# Altium project EVLSERVO1_control_v2.PrjPcb (part 5 of 9)
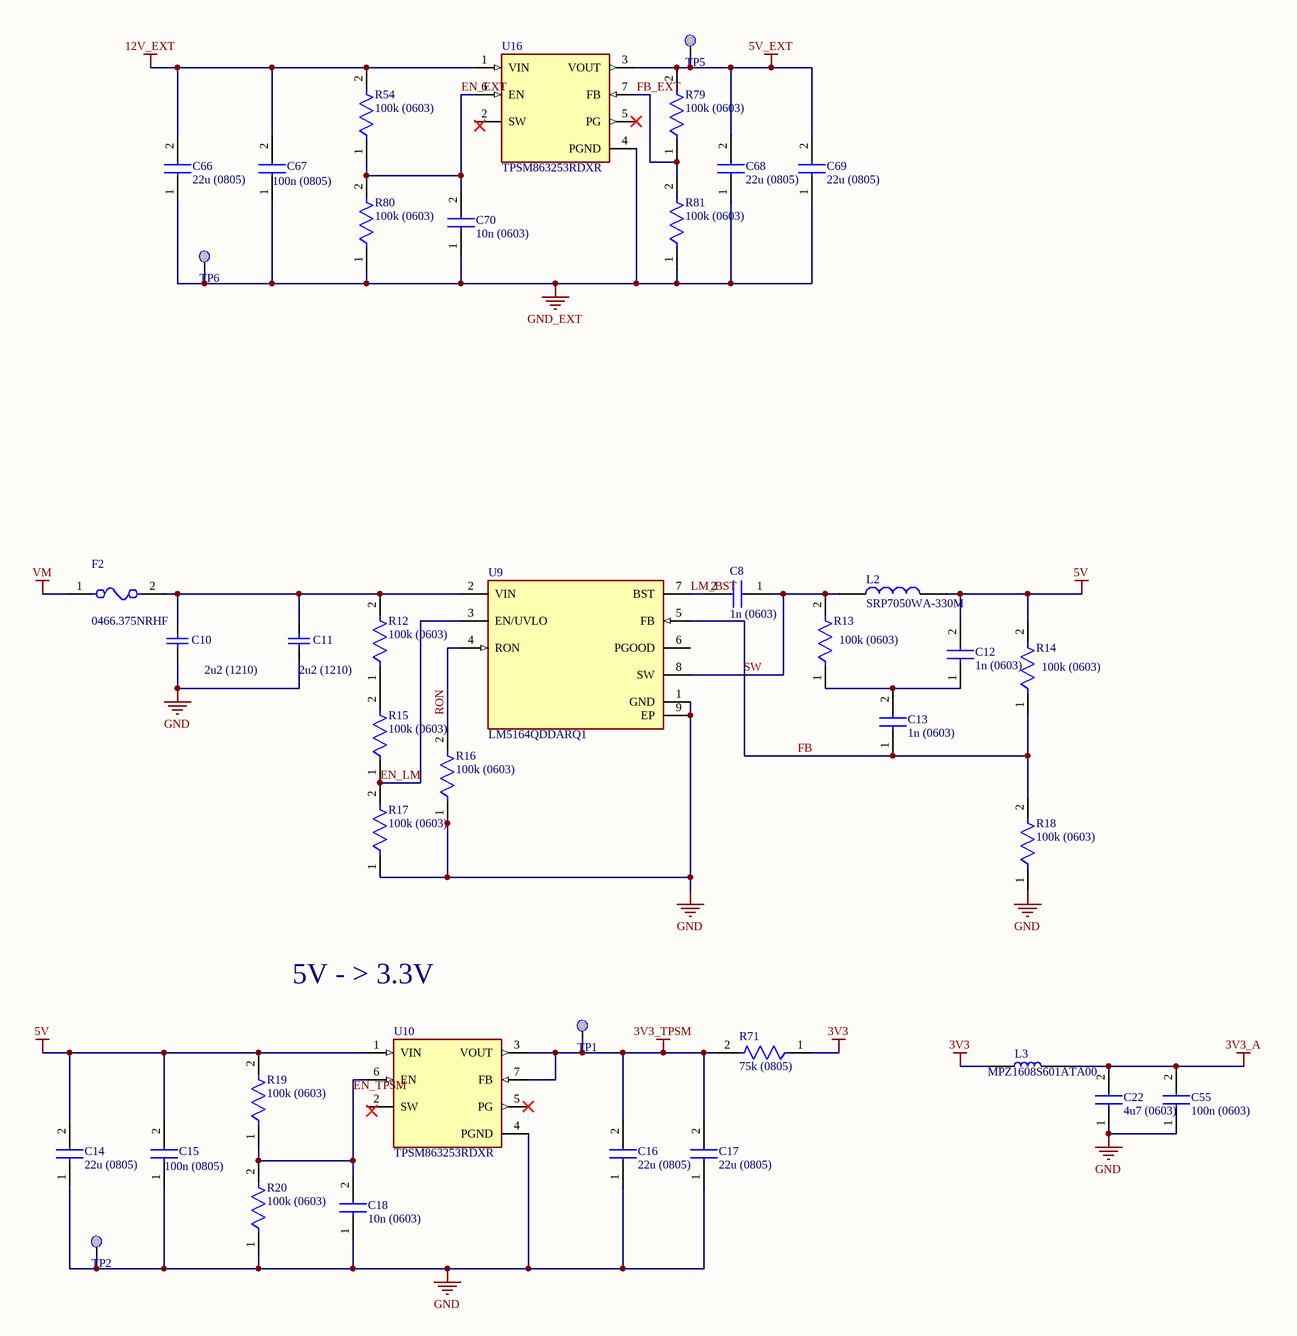
[diagram p8: power.SchDoc]

## Sheet power.SchDoc (continued)
### Library data of the parts
C8 C12 C13 = GCM188R71E102KA37D: Cap Ceramic 0.001uF 25V X7R 10% Pad SMD 0603 125C Automotive T/R; Manufacturer_Name: Murata Electronics; Manufacturer_Part_Number: GCM188R71E104JA57D; Manufacturer: Murata; Manufacturer Lifecycle Status: NRND; Value: 100nF; Datasheet Link: https://search.murata.co.jp/Ceramy/image/img/A01X/G101/ENG/GCM188R71E104JA57-01A.pdf; Height: 0.9mm; Mouser Part Number: 81-GCM188R71E104JAD; Mouser Price/Stock: https://www.mouser.co.uk/ProductDetail/Murata-Electronics/GCM188R71E104JA57D?qs=ui%252B2d9lVEI5lLkZDVYlCng%3D%3D; Arrow Part Number: GCM188R71E104JA57D; Arrow Price/Stock: https://www.arrow.com/en/products/gcm188r71e104ja57d/murata-manufacturing; Supplier: DigiKey; Supplier Part Number: 490-GCM188R71E104JA57DCT-ND; Manufacturer Part Number: GCM188R71E104JA57D; RoHS: Compliant; Category: Ceramic Capacitors; Stock: 2875; Pricing: 1=0,33, 10=0,196, 50=0,1434, 100=0,1272, 500=0,09986, 1000=0,09143 (USD); Case/Package: 0603; Country of Origin: Philippines; Dielectric Material: Ceramic; Export Control Classification Number (ECCN) Code: EAR99; Harmonized Tariff Schedule (HTS) Code: 8532.24.00.20; Introduction Date: 2013-11-20; Length: 1.6mm; Lifecycle Status: NRND; Max Operating Temperature: 125°C; Min Operating Temperature: -55°C; Mounting Technology: Surface Mount; Number of Terminals: 2; Ratings: AEC-Q200; REACH SVHC: Yes; Schedule B: 8532240020, 8532240020|8532240020|8532240020|8532240020|8532240020; Thickness: 800µm; Voltage Rating (DC): 25V; Width: 800µm; ComponentLink1URL: https://datasheet.octopart.com:443/GCM188R71E104JA57D-Murata-datasheet-141267551.pdf?src-supplier=Geoflip; ComponentLink1Description: https://datasheet.octopart.com:443/GCM188R71E104JA57D-Murata-datasheet-141267551.pdf?src-supplier=Geoflip; ComponentLink2URL: https://datasheet.octopart.com:443/GCM188R71E104JA57D-Murata-datasheet-140658663.pdf?src-supplier=Ciiva; ComponentLink2Description: https://datasheet.octopart.com:443/GCM188R71E104JA57D-Murata-datasheet-140658663.pdf?src-supplier=Ciiva; ComponentLink3URL: https://datasheet.octopart.com:443/GCM188R71E104JA57D-Murata-datasheet-138718229.pdf?src-supplier=Ciiva; ComponentLink3Description: https://datasheet.octopart.com:443/GCM188R71E104JA57D-Murata-datasheet-138718229.pdf?src-supplier=Ciiva; ComponentLink4URL: http://sigma.octopart.com:80/reach_statement/Murata-company-16.pdf?src-supplier=Compliance+Statements; ComponentLink4Description: http://sigma.octopart.com:80/reach_statement/Murata-company-16.pdf?src-supplier=Compliance+Statements; Case Code (Imperial): 0603; Case Code (Metric): 1608; Depth: 800µm; Dielectric: X7R; Packaging: Tape & Reel; Radiation Hardening: No; Termination: SMD/SMT; Tolerance: 10%; Voltage Rating: 25V; ComponentLink5URL: https://datasheet.octopart.com:443/GCM188R71E102KA37D-Murata-datasheet-141267546.pdf?src-supplier=Geoflip; ComponentLink5Description: https://datasheet.octopart.com:443/GCM188R71E102KA37D-Murata-datasheet-141267546.pdf?src-supplier=Geoflip; ComponentLink6URL: https://datasheet.octopart.com:443/GCM188R71E102KA37D-Murata-datasheet-140658658.pdf?src-supplier=Ciiva; ComponentLink6Description: https://datasheet.octopart.com:443/GCM188R71E102KA37D-Murata-datasheet-140658658.pdf?src-supplier=Ciiva; ComponentLink7URL: https://datasheet.octopart.com:443/GCM188R71E102KA37D-Murata-datasheet-138718224.pdf?src-supplier=Ciiva; ComponentLink7Description: https://datasheet.octopart.com:443/GCM188R71E102KA37D-Murata-datasheet-138718224.pdf?src-supplier=Ciiva; ComponentLink8URL: https://datasheet.octopart.com/GCM188R71E102KA37D-Murata-datasheet-14404865.pdf; ComponentLink8Description: https://datasheet.octopart.com/GCM188R71E102KA37D-Murata-datasheet-14404865.pdf
C10 C11 = CMP-03913-104794504-2: Cap, 2.2Uf, 100V, Mlcc, 1210 Rohs Compliant: Yes 885012209071; Insulation Resistance: 50MΩ; Length: 3.2mm; Min Operating Temperature: -55°C; Voltage Rating: 100V; Width: 2.5mm; Max Operating Temperature: 125°C; Height: 2.5mm; RoHS: Compliant; Parameter 1: *
C14 C16 C17 C66 C68 C69 = GMC21X5R226K16NT: Ceramic Capacitor, Multilayer, Ceramic, 16V, 10% +Tol, 10% -Tol, X5R, 15% TC, 22uF, Surface Mount, 0805; Manufacturer_Name: Murata Electronics; Manufacturer_Part_Number: GRM21BZ71E475KE15L; Manufacturer: Murata; Manufacturer Lifecycle Status: IN PRODUCTION; Value: 4.7µF; Voltage Rating: 25V; Dielectric: X7R; Voltage: 100V; Datasheet Link: https://search.murata.co.jp/Ceramy/image/img/A01X/G101/ENG/GRM21BZ71E475KE15-01A.pdf; Height: 1.45mm; Mouser Part Number: 81-GRM21BZ71E475KE5L; Mouser Price/Stock: https://www.mouser.co.uk/ProductDetail/Murata-Electronics/GRM21BZ71E475KE15L?qs=Ey7%2FXF42M3feXnDNgc%252BFlQ%3D%3D; Arrow Part Number: GRM21BZ71E475KE15L; Arrow Price/Stock: https://www.arrow.com/en/products/grm21bz71e475ke15l/murata-manufacturing?utm_currency=USD&region=nac; Supplier: RS; Supplier Part Number: 2478136; Manufacturer Part Number: GRM21BZ71E475KE15L; RoHS: Compliant; Category: Ceramic Capacitors; Stock: 4700; Case/Package: 0805; Dielectric Material: Ceramic; Export Control Classification Number (ECCN) Code: EAR99; Harmonized Tariff Schedule (HTS) Code: 8532.24.00.20; Introduction Date: 2017-02-22; Length: 2mm; Lifecycle Status: Production; Material: Ceramic; Max Operating Temperature: 125°C; Min Operating Temperature: -55°C; Mounting Technology: Surface Mount; Number of Terminals: 2; REACH SVHC: Yes; Thickness: 1.25mm; Tolerance: 10%; Voltage Rating (DC): 25V; Width: 1.25mm; ComponentLink1URL: https://datasheet.octopart.com:443/GRM21BZ71E475KE15L-Murata-datasheet-155345087.pdf?src-supplier=Newark; ComponentLink1Description: https://datasheet.octopart.com:443/GRM21BZ71E475KE15L-Murata-datasheet-155345087.pdf?src-supplier=Newark; ComponentLink2URL: https://datasheet.octopart.com:443/GRM21BZ71E475KE15L-Murata-datasheet-141278877.pdf?src-supplier=Geoflip; ComponentLink2Description: https://datasheet.octopart.com:443/GRM21BZ71E475KE15L-Murata-datasheet-141278877.pdf?src-supplier=Geoflip; ComponentLink3URL: https://datasheet.octopart.com:443/GRM21BZ71E475KE15L-Murata-datasheet-165579666.pdf?src-supplier=TME; ComponentLink3Description: https://datasheet.octopart.com:443/GRM21BZ71E475KE15L-Murata-datasheet-165579666.pdf?src-supplier=TME; ComponentLink4URL: https://datasheet.octopart.com:443/GRM21BZ71E475KE15L-Murata-datasheet-140707839.pdf?src-supplier=Ciiva; ComponentLink4Description: https://datasheet.octopart.com:443/GRM21BZ71E475KE15L-Murata-datasheet-140707839.pdf?src-supplier=Ciiva; ComponentLink5URL: https://datasheet.octopart.com:443/GRM21BZ71E475KE15L-Murata-datasheet-138745135.pdf?src-supplier=Ciiva; ComponentLink5Description: https://datasheet.octopart.com:443/GRM21BZ71E475KE15L-Murata-datasheet-138745135.pdf?src-supplier=Ciiva; ComponentLink6URL: http://sigma.octopart.com:80/reach_statement/Murata-company-16.pdf?src-supplier=Compliance+Statements; ComponentLink6Description: http://sigma.octopart.com:80/reach_statement/Murata-company-16.pdf?src-supplier=Compliance+Statements; Case Code (Imperial): 0805; Case Code (Metric): 2012; Country of Origin: Philippines; Depth: 1.25mm; Lead Free: Lead Free; Pins: 2; Packaging: Cut Tape; Radiation Hardening: No; Ratings: AEC-Q200; Schedule B: 8532240020, 8532240020|8532240020, 8532240020|8532240020|8532240020, 8532240020|8532240020|8532240020|8532240020; Termination: SMD/SMT; ComponentLink7URL: https://datasheet.octopart.com:443/GCM21BR72A104KA37L-Murata-datasheet-11892581.pdf?src-supplier=Upverter; ComponentLink7Description: https://datasheet.octopart.com:443/GCM21BR72A104KA37L-Murata-datasheet-11892581.pdf?src-supplier=Upverter; ComponentLink8URL: https://datasheet.octopart.com:443/GCM21BR72A104KA37L-Murata-datasheet-44104646.pdf?src-supplier=Upverter; ComponentLink8Description: https://datasheet.octopart.com:443/GCM21BR72A104KA37L-Murata-datasheet-44104646.pdf?src-supplier=Upverter; ComponentLink9URL: https://datasheet.octopart.com:443/GCM21BR72A104KA37L-Murata-datasheet-39128458.pdf?src-supplier=Newark; ComponentLink9Description: https://datasheet.octopart.com:443/GCM21BR72A104KA37L-Murata-datasheet-39128458.pdf?src-supplier=Newark; ComponentLink10URL: https://datasheet.octopart.com:443/GCM21BR72A104KA37L-Murata-datasheet-62316969.pdf?src-supplier=element14+APAC; ComponentLink10Description: https://datasheet.octopart.com:443/GCM21BR72A104KA37L-Murata-datasheet-62316969.pdf?src-supplier=element14+APAC; ComponentLink11URL: https://datasheet.octopart.com:443/GCM21BR72A104KA37L-Murata-datasheet-141268735.pdf?src-supplier=Geoflip; ComponentLink11Description: https://datasheet.octopart.com:443/GCM21BR72A104KA37L-Murata-datasheet-141268735.pdf?src-supplier=Geoflip; ComponentLink12URL: https://datasheet.octopart.com:443/GCM21BR72A104KA37L-Murata-datasheet-8331919.pdf?src-supplier=_legacy+Avnet; ComponentLink12Description: https://datasheet.octopart.com:443/GCM21BR72A104KA37L-Murata-datasheet-8331919.pdf?src-supplier=_legacy+Avnet; ComponentLink13URL: https://datasheet.octopart.com/GCM21BR72A104KA37L-Murata-datasheet-12553283.pdf; ComponentLink13Description: https://datasheet.octopart.com/GCM21BR72A104KA37L-Murata-datasheet-12553283.pdf; ComponentLink14URL: https://datasheet.octopart.com:443/GCM21BR72A104KA37L-Murata-datasheet-165579661.pdf?src-supplier=TME; ComponentLink14Description: https://datasheet.octopart.com:443/GCM21BR72A104KA37L-Murata-datasheet-165579661.pdf?src-supplier=TME; ComponentLink15URL: https://datasheet.octopart.com:443/GCM21BR72A104KA37L-Murata-datasheet-62117434.pdf?src-supplier=TME; ComponentLink15Description: https://datasheet.octopart.com:443/GCM21BR72A104KA37L-Murata-datasheet-62117434.pdf?src-supplier=TME; ComponentLink16URL: https://datasheet.octopart.com:443/GCM21BR72A104KA37L-Murata-datasheet-145011519.pdf?src-supplier=Megastar; ComponentLink16Description: https://datasheet.octopart.com:443/GCM21BR72A104KA37L-Murata-datasheet-145011519.pdf?src-supplier=Megastar; ComponentLink17URL: https://datasheet.octopart.com:443/GCM21BR72A104KA37L-Murata-datasheet-140660374.pdf?src-supplier=Ciiva; ComponentLink17Description: https://datasheet.octopart.com:443/GCM21BR72A104KA37L-Murata-datasheet-140660374.pdf?src-supplier=Ciiva; ComponentLink18URL: https://datasheet.octopart.com:443/GCM21BR72A104KA37L-Murata-datasheet-138719697.pdf?src-supplier=Ciiva; ComponentLink18Description: https://datasheet.octopart.com:443/GCM21BR72A104KA37L-Murata-datasheet-138719697.pdf?src-supplier=Ciiva; Pricing: 24=0,1298, 50=0,1289, 100=0,1131, 500=0,0881, 1000=0,0646 (USD); ComponentLink19URL: https://datasheet.octopart.com:443/GRM21BC71E106KE01L-Murata-datasheet-165579666.pdf?src-supplier=TME; ComponentLink19Description: https://datasheet.octopart.com:443/GRM21BC71E106KE01L-Murata-datasheet-165579666.pdf?src-supplier=TME; ComponentLink20URL: https://datasheet.octopart.com/GRM21BC71E106KE01L-Murata-datasheet-12515295.pdf; ComponentLink20Description: https://datasheet.octopart.com/GRM21BC71E106KE01L-Murata-datasheet-12515295.pdf; ComponentLink21URL: https://datasheet.octopart.com/GRM21BC71E106KE01L-Murata-datasheet-12510076.pdf; ComponentLink21Description: https://datasheet.octopart.com/GRM21BC71E106KE01L-Murata-datasheet-12510076.pdf; ComponentLink22URL: https://datasheet.octopart.com/GRM21BC71E106KE01L-Murata-datasheet-11978611.pdf; ComponentLink22Description: https://datasheet.octopart.com/GRM21BC71E106KE01L-Murata-datasheet-11978611.pdf; ComponentLink23URL: https://datasheet.octopart.com/GRM21BC71E106KE01L-Murata-datasheet-10025737.pdf; ComponentLink23Description: https://datasheet.octopart.com/GRM21BC71E106KE01L-Murata-datasheet-10025737.pdf; ComponentLink24URL: https://datasheet.octopart.com/GRM21BC71E106KE01L-Murata-datasheet-8819587.pdf; ComponentLink24Description: https://datasheet.octopart.com/GRM21BC71E106KE01L-Murata-datasheet-8819587.pdf; China RoHS: Compliant; ComponentLink25URL: https://datasheet.octopart.com:443/GMC21X5R226K16NT-Cal-Chip-Electronics-datasheet-182028815.pdf?src-supplier=IHS; ComponentLink25Description: https://datasheet.octopart.com:443/GMC21X5R226K16NT-Cal-Chip-Electronics-datasheet-182028815.pdf?src-supplier=IHS
C15 C67 = GCM21BR72A104KA37L: 100V 100nF X7R ±10% 0805 Multilayer Ceramic Capacitors MLCC - SMD/SMT ROHS; Manufacturer_Name: Murata Electronics; Manufacturer_Part_Number: GRM21BZ71E475KE15L; Manufacturer: Murata; Manufacturer Lifecycle Status: IN PRODUCTION; Value: 4.7µF; Voltage Rating: 25V; Datasheet Link: https://search.murata.co.jp/Ceramy/image/img/A01X/G101/ENG/GRM21BZ71E475KE15-01A.pdf; Height: 1.45mm; Mouser Part Number: 81-GRM21BZ71E475KE5L; Mouser Price/Stock: https://www.mouser.co.uk/ProductDetail/Murata-Electronics/GRM21BZ71E475KE15L?qs=Ey7%2FXF42M3feXnDNgc%252BFlQ%3D%3D; Arrow Part Number: GRM21BZ71E475KE15L; Arrow Price/Stock: https://www.arrow.com/en/products/grm21bz71e475ke15l/murata-manufacturing?utm_currency=USD&region=nac; Supplier: RS; Supplier Part Number: 2478136; Manufacturer Part Number: GRM21BZ71E475KE15L; RoHS: Compliant; Category: Ceramic Capacitors; Stock: 4700; Case/Package: 0805; Dielectric Material: Ceramic; Export Control Classification Number (ECCN) Code: EAR99; Harmonized Tariff Schedule (HTS) Code: 8532.24.00.20; Introduction Date: 2017-02-22; Length: 2mm; Lifecycle Status: Production; Material: Ceramic; Max Operating Temperature: 125°C; Min Operating Temperature: -55°C; Mounting Technology: Surface Mount; Number of Terminals: 2; REACH SVHC: Yes; Thickness: 1.25mm; Tolerance: 10%; Voltage Rating (DC): 25V; Width: 1.25mm; ComponentLink1URL: https://datasheet.octopart.com:443/GRM21BZ71E475KE15L-Murata-datasheet-155345087.pdf?src-supplier=Newark; ComponentLink1Description: https://datasheet.octopart.com:443/GRM21BZ71E475KE15L-Murata-datasheet-155345087.pdf?src-supplier=Newark; ComponentLink2URL: https://datasheet.octopart.com:443/GRM21BZ71E475KE15L-Murata-datasheet-141278877.pdf?src-supplier=Geoflip; ComponentLink2Description: https://datasheet.octopart.com:443/GRM21BZ71E475KE15L-Murata-datasheet-141278877.pdf?src-supplier=Geoflip; ComponentLink3URL: https://datasheet.octopart.com:443/GRM21BZ71E475KE15L-Murata-datasheet-165579666.pdf?src-supplier=TME; ComponentLink3Description: https://datasheet.octopart.com:443/GRM21BZ71E475KE15L-Murata-datasheet-165579666.pdf?src-supplier=TME; ComponentLink4URL: https://datasheet.octopart.com:443/GRM21BZ71E475KE15L-Murata-datasheet-140707839.pdf?src-supplier=Ciiva; ComponentLink4Description: https://datasheet.octopart.com:443/GRM21BZ71E475KE15L-Murata-datasheet-140707839.pdf?src-supplier=Ciiva; ComponentLink5URL: https://datasheet.octopart.com:443/GRM21BZ71E475KE15L-Murata-datasheet-138745135.pdf?src-supplier=Ciiva; ComponentLink5Description: https://datasheet.octopart.com:443/GRM21BZ71E475KE15L-Murata-datasheet-138745135.pdf?src-supplier=Ciiva; ComponentLink6URL: http://sigma.octopart.com:80/reach_statement/Murata-company-16.pdf?src-supplier=Compliance+Statements; ComponentLink6Description: http://sigma.octopart.com:80/reach_statement/Murata-company-16.pdf?src-supplier=Compliance+Statements; Case Code (Imperial): 0805; Case Code (Metric): 2012; Country of Origin: Philippines; Depth: 1.25mm; Dielectric: X7R; Lead Free: Lead Free; Pins: 2; Packaging: Cut Tape; Radiation Hardening: No; Ratings: AEC-Q200; Schedule B: 8532240020, 8532240020|8532240020, 8532240020|8532240020|8532240020, 8532240020|8532240020|8532240020|8532240020; Termination: SMD/SMT; Voltage: 100V; ComponentLink7URL: https://datasheet.octopart.com:443/GCM21BR72A104KA37L-Murata-datasheet-11892581.pdf?src-supplier=Upverter; ComponentLink7Description: https://datasheet.octopart.com:443/GCM21BR72A104KA37L-Murata-datasheet-11892581.pdf?src-supplier=Upverter; ComponentLink8URL: https://datasheet.octopart.com:443/GCM21BR72A104KA37L-Murata-datasheet-44104646.pdf?src-supplier=Upverter; ComponentLink8Description: https://datasheet.octopart.com:443/GCM21BR72A104KA37L-Murata-datasheet-44104646.pdf?src-supplier=Upverter; ComponentLink9URL: https://datasheet.octopart.com:443/GCM21BR72A104KA37L-Murata-datasheet-39128458.pdf?src-supplier=Newark; ComponentLink9Description: https://datasheet.octopart.com:443/GCM21BR72A104KA37L-Murata-datasheet-39128458.pdf?src-supplier=Newark; ComponentLink10URL: https://datasheet.octopart.com:443/GCM21BR72A104KA37L-Murata-datasheet-62316969.pdf?src-supplier=element14+APAC; ComponentLink10Description: https://datasheet.octopart.com:443/GCM21BR72A104KA37L-Murata-datasheet-62316969.pdf?src-supplier=element14+APAC; ComponentLink11URL: https://datasheet.octopart.com:443/GCM21BR72A104KA37L-Murata-datasheet-141268735.pdf?src-supplier=Geoflip; ComponentLink11Description: https://datasheet.octopart.com:443/GCM21BR72A104KA37L-Murata-datasheet-141268735.pdf?src-supplier=Geoflip; ComponentLink12URL: https://datasheet.octopart.com:443/GCM21BR72A104KA37L-Murata-datasheet-8331919.pdf?src-supplier=_legacy+Avnet; ComponentLink12Description: https://datasheet.octopart.com:443/GCM21BR72A104KA37L-Murata-datasheet-8331919.pdf?src-supplier=_legacy+Avnet; ComponentLink13URL: https://datasheet.octopart.com/GCM21BR72A104KA37L-Murata-datasheet-12553283.pdf; ComponentLink13Description: https://datasheet.octopart.com/GCM21BR72A104KA37L-Murata-datasheet-12553283.pdf; ComponentLink14URL: https://datasheet.octopart.com:443/GCM21BR72A104KA37L-Murata-datasheet-165579661.pdf?src-supplier=TME; ComponentLink14Description: https://datasheet.octopart.com:443/GCM21BR72A104KA37L-Murata-datasheet-165579661.pdf?src-supplier=TME; ComponentLink15URL: https://datasheet.octopart.com:443/GCM21BR72A104KA37L-Murata-datasheet-62117434.pdf?src-supplier=TME; ComponentLink15Description: https://datasheet.octopart.com:443/GCM21BR72A104KA37L-Murata-datasheet-62117434.pdf?src-supplier=TME; ComponentLink16URL: https://datasheet.octopart.com:443/GCM21BR72A104KA37L-Murata-datasheet-145011519.pdf?src-supplier=Megastar; ComponentLink16Description: https://datasheet.octopart.com:443/GCM21BR72A104KA37L-Murata-datasheet-145011519.pdf?src-supplier=Megastar; ComponentLink17URL: https://datasheet.octopart.com:443/GCM21BR72A104KA37L-Murata-datasheet-140660374.pdf?src-supplier=Ciiva; ComponentLink17Description: https://datasheet.octopart.com:443/GCM21BR72A104KA37L-Murata-datasheet-140660374.pdf?src-supplier=Ciiva; ComponentLink18URL: https://datasheet.octopart.com:443/GCM21BR72A104KA37L-Murata-datasheet-138719697.pdf?src-supplier=Ciiva; ComponentLink18Description: https://datasheet.octopart.com:443/GCM21BR72A104KA37L-Murata-datasheet-138719697.pdf?src-supplier=Ciiva; ClassName: buck_12V
C18 C70 = CC0603KRX7R8BB103: Surface Mount Ceramic Multilayer Capacitor 0.01uF 10% X7R 25V 0603 Paper T/R; Manufacturer_Name: Murata Electronics; Manufacturer_Part_Number: GCM188R71E104JA57D; Manufacturer: Murata; Manufacturer Lifecycle Status: NRND; Value: 100nF; Insulation Resistance: 100GΩ; Datasheet Link: https://search.murata.co.jp/Ceramy/image/img/A01X/G101/ENG/GCM188R71E104JA57-01A.pdf; Height: 0.9mm; Mouser Part Number: 81-GCM188R71E104JAD; Mouser Price/Stock: https://www.mouser.co.uk/ProductDetail/Murata-Electronics/GCM188R71E104JA57D?qs=ui%252B2d9lVEI5lLkZDVYlCng%3D%3D; Arrow Part Number: GCM188R71E104JA57D; Arrow Price/Stock: https://www.arrow.com/en/products/gcm188r71e104ja57d/murata-manufacturing; Supplier: DigiKey; Supplier Part Number: 490-GCM188R71E104JA57DCT-ND; Manufacturer Part Number: GCM188R71E104JA57D; RoHS: Compliant; Category: Ceramic Capacitors; Stock: 2875; Pricing: 1=0,33, 10=0,196, 50=0,1434, 100=0,1272, 500=0,09986, 1000=0,09143 (USD); Case/Package: 0603; Country of Origin: Philippines; Dielectric Material: Ceramic; Export Control Classification Number (ECCN) Code: EAR99; Harmonized Tariff Schedule (HTS) Code: 8532.24.00.20; Introduction Date: 2013-11-20; Length: 1.6mm; Lifecycle Status: NRND; Max Operating Temperature: 125°C; Min Operating Temperature: -55°C; Mounting Technology: Surface Mount; Number of Terminals: 2; Ratings: AEC-Q200; REACH SVHC: Yes; Schedule B: 8532240020, 8532240020|8532240020|8532240020|8532240020|8532240020; Thickness: 800µm; Voltage Rating (DC): 25V; Width: 800µm; ComponentLink1URL: https://datasheet.octopart.com:443/GCM188R71E104JA57D-Murata-datasheet-141267551.pdf?src-supplier=Geoflip; ComponentLink1Description: https://datasheet.octopart.com:443/GCM188R71E104JA57D-Murata-datasheet-141267551.pdf?src-supplier=Geoflip; ComponentLink2URL: https://datasheet.octopart.com:443/GCM188R71E104JA57D-Murata-datasheet-140658663.pdf?src-supplier=Ciiva; ComponentLink2Description: https://datasheet.octopart.com:443/GCM188R71E104JA57D-Murata-datasheet-140658663.pdf?src-supplier=Ciiva; ComponentLink3URL: https://datasheet.octopart.com:443/GCM188R71E104JA57D-Murata-datasheet-138718229.pdf?src-supplier=Ciiva; ComponentLink3Description: https://datasheet.octopart.com:443/GCM188R71E104JA57D-Murata-datasheet-138718229.pdf?src-supplier=Ciiva; ComponentLink4URL: http://sigma.octopart.com:80/reach_statement/Murata-company-16.pdf?src-supplier=Compliance+Statements; ComponentLink4Description: http://sigma.octopart.com:80/reach_statement/Murata-company-16.pdf?src-supplier=Compliance+Statements; Case Code (Imperial): 0603; Case Code (Metric): 1608; China RoHS: Compliant; Composition: Ceramic; Depth: 800µm; Dielectric: X7R; Halogen Free: Halogen Free; Lead Free: Lead Free; Material: Ceramic; Pins: 2; Radiation Hardening: No; Termination: SMD/SMT; Tolerance: 10%; Voltage: 25V; Voltage Rating: 25V; ComponentLink5URL: https://datasheet.octopart.com:443/CC0603KRX7R8BB103-Yageo-datasheet-177165144.pdf?src-supplier=IHS; ComponentLink5Description: https://datasheet.octopart.com:443/CC0603KRX7R8BB103-Yageo-datasheet-177165144.pdf?src-supplier=IHS; ComponentLink6URL: https://datasheet.octopart.com:443/CC0603KRX7R8BB103-Yageo-datasheet-82288757.pdf?src-supplier=Upverter; ComponentLink6Description: https://datasheet.octopart.com:443/CC0603KRX7R8BB103-Yageo-datasheet-82288757.pdf?src-supplier=Upverter; ComponentLink7URL: https://datasheet.octopart.com/CC0603KRX7R8BB103-Yageo-datasheet-10883670.pdf; ComponentLink7Description: https://datasheet.octopart.com/CC0603KRX7R8BB103-Yageo-datasheet-10883670.pdf; ComponentLink8URL: https://datasheet.octopart.com:443/CC0603KRX7R8BB103-Yageo-datasheet-181968690.pdf?src-supplier=Newark; ComponentLink8Description: https://datasheet.octopart.com:443/CC0603KRX7R8BB103-Yageo-datasheet-181968690.pdf?src-supplier=Newark; ComponentLink9URL: https://datasheet.octopart.com:443/CC0603KRX7R8BB103-Yageo-datasheet-147453679.pdf?src-supplier=Newark; ComponentLink9Description: https://datasheet.octopart.com:443/CC0603KRX7R8BB103-Yageo-datasheet-147453679.pdf?src-supplier=Newark; ComponentLink10URL: https://datasheet.octopart.com:443/CC0603KRX7R8BB103-Phycomp-datasheet-499490.pdf?src-supplier=Newark; ComponentLink10Description: https://datasheet.octopart.com:443/CC0603KRX7R8BB103-Phycomp-datasheet-499490.pdf?src-supplier=Newark; ComponentLink11URL: https://datasheet.octopart.com:443/CC0603KRX7R8BB103-Yageo-datasheet-5301394.pdf?src-supplier=Newark; ComponentLink11Description: https://datasheet.octopart.com:443/CC0603KRX7R8BB103-Yageo-datasheet-5301394.pdf?src-supplier=Newark; ComponentLink12URL: https://datasheet.octopart.com:443/CC0603KRX7R8BB103-Yageo-datasheet-62336348.pdf?src-supplier=Farnell; ComponentLink12Description: https://datasheet.octopart.com:443/CC0603KRX7R8BB103-Yageo-datasheet-62336348.pdf?src-supplier=Farnell; ComponentLink13URL: https://datasheet.octopart.com:443/CC0603KRX7R8BB103-Phycomp-datasheet-500777.pdf?src-supplier=Farnell; ComponentLink13Description: https://datasheet.octopart.com:443/CC0603KRX7R8BB103-Phycomp-datasheet-500777.pdf?src-supplier=Farnell; ComponentLink14URL: https://datasheet.octopart.com:443/CC0603KRX7R8BB103-Yageo-datasheet-151948686.pdf?src-supplier=TME; ComponentLink14Description: https://datasheet.octopart.com:443/CC0603KRX7R8BB103-Yageo-datasheet-151948686.pdf?src-supplier=TME; ComponentLink15URL: https://datasheet.octopart.com:443/CC0603KRX7R8BB103-Yageo-Group-datasheet-184163374.pdf?src-supplier=LCSC; ComponentLink15Description: https://datasheet.octopart.com:443/CC0603KRX7R8BB103-Yageo-Group-datasheet-184163374.pdf?src-supplier=LCSC; ComponentLink16URL: https://datasheet.octopart.com:443/CC0603KRX7R8BB103-Yageo-datasheet-166511530.pdf?src-supplier=Future+Electronics; ComponentLink16Description: https://datasheet.octopart.com:443/CC0603KRX7R8BB103-Yageo-datasheet-166511530.pdf?src-supplier=Future+Electronics; ComponentLink17URL: https://datasheet.octopart.com:443/CC0603KRX7R8BB103-Yageo-datasheet-137700082.pdf?src-supplier=Future+Electronics; ComponentLink17Description: https://datasheet.octopart.com:443/CC0603KRX7R8BB103-Yageo-datasheet-137700082.pdf?src-supplier=Future+Electronics; ComponentLink18URL: https://datasheet.octopart.com:443/CC0603KRX7R8BB103-Yageo-datasheet-137700084.pdf?src-supplier=Future+Electronics; ComponentLink18Description: https://datasheet.octopart.com:443/CC0603KRX7R8BB103-Yageo-datasheet-137700084.pdf?src-supplier=Future+Electronics; ComponentLink19URL: https://datasheet.octopart.com:443/CC0603KRX7R8BB103-Yageo-datasheet-27626582.pdf?src-supplier=Future+Electronics; ComponentLink19Description: https://datasheet.octopart.com:443/CC0603KRX7R8BB103-Yageo-datasheet-27626582.pdf?src-supplier=Future+Electronics; ComponentLink20URL: https://datasheet.octopart.com:443/CC0603KRX7R8BB103-Yageo-datasheet-15895757.pdf?src-supplier=Future+Electronics; ComponentLink20Description: https://datasheet.octopart.com:443/CC0603KRX7R8BB103-Yageo-datasheet-15895757.pdf?src-supplier=Future+Electronics; ComponentLink21URL: https://datasheet.octopart.com:443/CC0603KRX7R8BB103-Yageo-datasheet-12526321.pdf?src-supplier=Future+Electronics; ComponentLink21Description: https://datasheet.octopart.com:443/CC0603KRX7R8BB103-Yageo-datasheet-12526321.pdf?src-supplier=Future+Electronics; ComponentLink22URL: https://datasheet.octopart.com:443/CC0603KRX7R8BB103-Yageo-datasheet-10911834.pdf?src-supplier=Future+Electronics; ComponentLink22Description: https://datasheet.octopart.com:443/CC0603KRX7R8BB103-Yageo-datasheet-10911834.pdf?src-supplier=Future+Electronics; ComponentLink23URL: https://datasheet.octopart.com:443/CC0603KRX7R8BB103-Yageo-datasheet-8324442.pdf?src-supplier=Future+Electronics; ComponentLink23Description: https://datasheet.octopart.com:443/CC0603KRX7R8BB103-Yageo-datasheet-8324442.pdf?src-supplier=Future+Electronics; ComponentLink24URL: https://datasheet.octopart.com:443/CC0603KRX7R8BB103-Yageo-Group-datasheet-165992755.pdf?src-supplier=ODG+(Origin+Data+Global); ComponentLink24Description: https://datasheet.octopart.com:443/CC0603KRX7R8BB103-Yageo-Group-datasheet-165992755.pdf?src-supplier=ODG+(Origin+Data+Global); ComponentLink25URL: https://datasheet.octopart.com:443/CC0603KRX7R8BB103-Yageo-datasheet-8701427.pdf?src-supplier=element14; ComponentLink25Description: https://datasheet.octopart.com:443/CC0603KRX7R8BB103-Yageo-datasheet-8701427.pdf?src-supplier=element14; ComponentLink26URL: http://sigma.octopart.com:80/conflict_mineral_statement/Yageo-company-3.pdf?src-supplier=Compliance+Statements; ComponentLink26Description: http://sigma.octopart.com:80/conflict_mineral_statement/Yageo-company-3.pdf?src-supplier=Compliance+Statements; ComponentLink27URL: http://sigma.octopart.com:80/rohs_statement/Yageo-company-2.pdf?src-supplier=Compliance+Statements; ComponentLink27Description: http://sigma.octopart.com:80/rohs_statement/Yageo-company-2.pdf?src-supplier=Compliance+Statements
C22 C55 = GCM188R71E105KA64D: 25V 1uF X7R ±10% 0603 Multilayer Ceramic Capacitors MLCC - SMD/SMT ROHS; Manufacturer_Name: Murata Electronics; Manufacturer_Part_Number: GCM188R71E104JA57D; Manufacturer: Murata; Manufacturer Lifecycle Status: NRND; Value: 100nF; Datasheet Link: https://search.murata.co.jp/Ceramy/image/img/A01X/G101/ENG/GCM188R71E104JA57-01A.pdf; Height: 0.9mm; Mouser Part Number: 81-GCM188R71E104JAD; Mouser Price/Stock: https://www.mouser.co.uk/ProductDetail/Murata-Electronics/GCM188R71E104JA57D?qs=ui%252B2d9lVEI5lLkZDVYlCng%3D%3D; Arrow Part Number: GCM188R71E104JA57D; Arrow Price/Stock: https://www.arrow.com/en/products/gcm188r71e104ja57d/murata-manufacturing; Supplier: DigiKey; Supplier Part Number: 490-GCM188R71E104JA57DCT-ND; Manufacturer Part Number: GCM188R71E104JA57D; RoHS: Compliant; Category: Ceramic Capacitors; Stock: 2875; Pricing: 1=0,33, 10=0,196, 50=0,1434, 100=0,1272, 500=0,09986, 1000=0,09143 (USD); Case/Package: 0603; Country of Origin: Philippines; Dielectric Material: Ceramic; Export Control Classification Number (ECCN) Code: EAR99; Harmonized Tariff Schedule (HTS) Code: 8532.24.00.20; Introduction Date: 2013-11-20; Length: 1.6mm; Lifecycle Status: NRND; Max Operating Temperature: 125°C; Min Operating Temperature: -55°C; Mounting Technology: Surface Mount; Number of Terminals: 2; Ratings: AEC-Q200; REACH SVHC: Yes; Schedule B: 8532240020, 8532240020|8532240020|8532240020|8532240020|8532240020; Thickness: 800µm; Voltage Rating (DC): 25V; Width: 800µm; ComponentLink1URL: https://datasheet.octopart.com:443/GCM188R71E104JA57D-Murata-datasheet-141267551.pdf?src-supplier=Geoflip; ComponentLink1Description: https://datasheet.octopart.com:443/GCM188R71E104JA57D-Murata-datasheet-141267551.pdf?src-supplier=Geoflip; ComponentLink2URL: https://datasheet.octopart.com:443/GCM188R71E104JA57D-Murata-datasheet-140658663.pdf?src-supplier=Ciiva; ComponentLink2Description: https://datasheet.octopart.com:443/GCM188R71E104JA57D-Murata-datasheet-140658663.pdf?src-supplier=Ciiva; ComponentLink3URL: https://datasheet.octopart.com:443/GCM188R71E104JA57D-Murata-datasheet-138718229.pdf?src-supplier=Ciiva; ComponentLink3Description: https://datasheet.octopart.com:443/GCM188R71E104JA57D-Murata-datasheet-138718229.pdf?src-supplier=Ciiva; ComponentLink4URL: http://sigma.octopart.com:80/reach_statement/Murata-company-16.pdf?src-supplier=Compliance+Statements; ComponentLink4Description: http://sigma.octopart.com:80/reach_statement/Murata-company-16.pdf?src-supplier=Compliance+Statements; Case Code (Imperial): 0603; Case Code (Metric): 1608; Depth: 800µm; Dielectric: X7R; Lead Free: Lead Free; Material: Ceramic; Packaging: Cut Tape; Radiation Hardening: No; Termination: SMD/SMT; Tolerance: 10%; Voltage: 25V; Voltage Rating: 25V; Weight: 6.293594mg; ComponentLink5URL: https://datasheet.octopart.com:443/GCM188R71E105KA64D-Murata-datasheet-39128443.pdf?src-supplier=Newark; ComponentLink5Description: https://datasheet.octopart.com:443/GCM188R71E105KA64D-Murata-datasheet-39128443.pdf?src-supplier=Newark; ComponentLink6URL: https://datasheet.octopart.com:443/GCM188R71E105KA64D-Murata-datasheet-62316951.pdf?src-supplier=element14+APAC; ComponentLink6Description: https://datasheet.octopart.com:443/GCM188R71E105KA64D-Murata-datasheet-62316951.pdf?src-supplier=element14+APAC; ComponentLink7URL: https://datasheet.octopart.com:443/GCM188R71E105KA64D-Murata-datasheet-141267554.pdf?src-supplier=Geoflip; ComponentLink7Description: https://datasheet.octopart.com:443/GCM188R71E105KA64D-Murata-datasheet-141267554.pdf?src-supplier=Geoflip; ComponentLink8URL: https://datasheet.octopart.com:443/GCM188R71E105KA64D-Murata-datasheet-140658666.pdf?src-supplier=Ciiva; ComponentLink8Description: https://datasheet.octopart.com:443/GCM188R71E105KA64D-Murata-datasheet-140658666.pdf?src-supplier=Ciiva; ComponentLink9URL: https://datasheet.octopart.com:443/GCM188R71E105KA64D-Murata-datasheet-138718232.pdf?src-supplier=Ciiva; ComponentLink9Description: https://datasheet.octopart.com:443/GCM188R71E105KA64D-Murata-datasheet-138718232.pdf?src-supplier=Ciiva; ComponentLink10URL: https://datasheet.octopart.com:443/GCM188R71E105KA64D-Murata-datasheet-81455541.pdf?src-supplier=TME; ComponentLink10Description: https://datasheet.octopart.com:443/GCM188R71E105KA64D-Murata-datasheet-81455541.pdf?src-supplier=TME; ComponentLink11URL: https://datasheet.octopart.com/GCM188R71E105KA64D-Murata-datasheet-14404430.pdf; ComponentLink11Description: https://datasheet.octopart.com/GCM188R71E105KA64D-Murata-datasheet-14404430.pdf; ComponentLink12URL: https://datasheet.octopart.com:443/GCM188R71E105KA64D-Murata-datasheet-14393380.pdf?src-supplier=Future+Electronics; ComponentLink12Description: https://datasheet.octopart.com:443/GCM188R71E105KA64D-Murata-datasheet-14393380.pdf?src-supplier=Future+Electronics; ComponentLink13URL: https://datasheet.octopart.com:443/GCM188R71E105KA64D-Murata-datasheet-44103482.pdf?src-supplier=Future+Electronics; ComponentLink13Description: https://datasheet.octopart.com:443/GCM188R71E105KA64D-Murata-datasheet-44103482.pdf?src-supplier=Future+Electronics
F2 = CMP-08605-000091-1: FUSE BOARD MNT 375MA 125VAC/VDC; DC Cold Resistance: 350mR; Voltage Rating (DC): 125V; Approvals: UL; Power Dissipation: 63.4mW; Fuse Type: Board Mount (Cartridge Style Excluded); Case Code (Imperial): 1206; Case Code (Metric): 3216; RoHS Compliant: Yes; Max Operating Temperature: 90°C; Width: 0.06inch; Depth: 1.52mm; Min Operating Temperature: -55°C; Series: SlimLine™ 466; Packaging: Tape and Reel; Package Quantity: 5000; Mount: Surface Mount; Case/Package: 1206; Current: 375mA; Height: 0.023inch; Voltage Rating (AC): 125V; Length: 3.18mm; Current Rating: 375mA; Housing Material: Ceramic
L2 = SRP7050WA-330M: Ind,7.9x7.3x5.2mm,33uH+/-20%,4A,shd; Manufacturer_Name: Bourns; Geometry.Height: 5.4mm; TME Electronic Components Part Number: *; TME Electronic Components Price/Stock: *; Manufacturer_Part_Number: SRP7050WA-330M; Datasheet Link: https://g.componentsearchengine.com/Datasheets/0/17601809.pdf
L3 = MPZ1608S601ATA00: Ferrite Beads Multi-Layer 600Ohm 25% 100MHz 1A 0.15Ohm DCR 0603 T/R; Manufacturer Lifecycle Status: PRODUCTION; MF: TDK; DC Resistance (DCR): 150mΩ; Impedance: 600Ω; Number of Circuits: 1; SnapEDA_Link: https://www.snapeda.com/parts/MPZ1608S601ATA00/TDK/view-part/?ref=snap; Package: 0603 TDK; Value: *; MP: MPZ1608S601ATA00; Check_prices: https://www.snapeda.com/parts/MPZ1608S601ATA00/TDK/view-part/?ref=eda; Supplier: Farnell; Supplier Part Number: 2800777; Manufacturer: TDK; Manufacturer Part Number: MPZ1608S601ATA00; RoHS: Compliant; Category: Ferrite Beads and Chips; Stock: 80000; Case/Package: 0603; Case Code (Imperial): 0603; Case Code (Metric): 1608; China RoHS: Compliant; Core Material: Ferrite; Current Rating: 1A; Depth: 800µm; Height: 800µm; Lead Free: Lead Free; Length: 1.6mm; Lifecycle Status: Production; Max DC Current: 1A; Clock Frequency: 100MHz; Max Length: 1.75mm; Max Operating Temperature: 125°C; Max Width: 950µm; Min Length: 1.45mm; Min Operating Temperature: -55°C; Min Width: 650µm; Mounting Technology: Surface Mount; Number of Terminals: 2; Packaging: Cut Tape; REACH SVHC: Yes; RMS Current (Irms): 1A; Schedule B: 8504500000, 8504500000|8504500000|8504500000|8504500000|8504500000; ESR: 150mΩ; Termination: SMD/SMT; Test Frequency: 100MHz; Tolerance: 25%; Weight: 2.012816mg; Width: 800µm; ComponentLink1URL: https://datasheet.octopart.com:443/MPZ1608S601ATA00-TDK-datasheet-155380319.pdf?src-supplier=TDK; ComponentLink1Description: https://datasheet.octopart.com:443/MPZ1608S601ATA00-TDK-datasheet-155380319.pdf?src-supplier=TDK; ComponentLink2URL: https://datasheet.octopart.com:443/MPZ1608S601ATA00-TDK-datasheet-141913842.pdf?src-supplier=TME; ComponentLink2Description: https://datasheet.octopart.com:443/MPZ1608S601ATA00-TDK-datasheet-141913842.pdf?src-supplier=TME; ComponentLink3URL: https://datasheet.octopart.com:443/MPZ1608S601ATA00-TDK-datasheet-82475260.pdf?src-supplier=Newark; ComponentLink3Description: https://datasheet.octopart.com:443/MPZ1608S601ATA00-TDK-datasheet-82475260.pdf?src-supplier=Newark; ComponentLink4URL: https://datasheet.octopart.com:443/MPZ1608S601ATA00-TDK-datasheet-99917310.pdf?src-supplier=Newark; ComponentLink4Description: https://datasheet.octopart.com:443/MPZ1608S601ATA00-TDK-datasheet-99917310.pdf?src-supplier=Newark; ComponentLink5URL: https://datasheet.octopart.com:443/MPZ1608S601ATA00-TDK-datasheet-8852356.pdf?src-supplier=Newark; ComponentLink5Description: https://datasheet.octopart.com:443/MPZ1608S601ATA00-TDK-datasheet-8852356.pdf?src-supplier=Newark; ComponentLink6URL: https://datasheet.octopart.com:443/MPZ1608S601ATA00-TDK-datasheet-21631858.pdf?src-supplier=Farnell; ComponentLink6Description: https://datasheet.octopart.com:443/MPZ1608S601ATA00-TDK-datasheet-21631858.pdf?src-supplier=Farnell; ComponentLink7URL: https://datasheet.octopart.com:443/MPZ1608S601ATA00-TDK-datasheet-38423207.pdf?src-supplier=Future+Electronics; ComponentLink7Description: https://datasheet.octopart.com:443/MPZ1608S601ATA00-TDK-datasheet-38423207.pdf?src-supplier=Future+Electronics
R12-R18 = RNCP0603FTD10K0: Res Thin Film 0603 10K Ohm 1% 1/8W ±100ppm/°C Molded SMD SMD Paper T/R; Manufacturer_Name: Yageo Group; Manufacturer_Part_Number: SR0603FR-7T10KL; Power Rating: 250mW; Value: 10kΩ; Voltage Rating: 75V; Working Voltage: 150V; Voltage Rating (DC): 50V; Max Power Dissipation: 125mW; Datasheet Link: https://mouser.componentsearchengine.com/Datasheets/1/SR0603FR-7T10KL.pdf; Height: 0.55mm; Mouser Part Number: 603-SR0603FR-7T10KL; Mouser Price/Stock: https://www.mouser.co.uk/ProductDetail/YAGEO/SR0603FR-7T10KL?qs=pfd5qewlna6IurLw3u3uRA%3D%3D; Arrow Part Number: SR0603FR-7T10KL; Arrow Price/Stock: https://www.arrow.com/en/products/sr0603fr-7t10kl/yageo; Supplier: DigiKey; Supplier Part Number: YAG5823CT-ND; Manufacturer: Yageo Group; Manufacturer Part Number: SR0603FR-7T10KL; RoHS: Compliant; Category: Chip SMD Resistors; Pricing: 1=0,67, 10=0,399, 25=0,3376, 50=0,3022, 100=0,2744, 250=0,24612, 500=0,22976, 1000=0,21675 (USD); Case/Package: 0603; China RoHS: Non-Compliant; Composition: Thick Film; Country of Origin: Mainland China, Taiwan; Export Control Classification Number (ECCN) Code: EAR99; Harmonized Tariff Schedule (HTS) Code: 8533.21.00.30; Introduction Date: 2017-10-02; Length: 1.6mm; Lifecycle Status: Production; Max Operating Temperature: 155°C; Min Operating Temperature: -55°C; Mounting Technology: Surface Mount; Number of Terminals: 2; Packaging: Tape & Reel; Ratings: AEC-Q200; REACH SVHC: Yes; Temperature Coefficient: 100ppm/°C; Tolerance: 1%; Width: 800µm; ComponentLink1URL: https://datasheet.octopart.com:443/SR0603FR-7T10KL-Yageo-datasheet-176402240.pdf?src-supplier=Farnell; ComponentLink1Description: https://datasheet.octopart.com:443/SR0603FR-7T10KL-Yageo-datasheet-176402240.pdf?src-supplier=Farnell; ComponentLink2URL: https://datasheet.octopart.com:443/SR0603FR-7T10KL-Yageo-datasheet-119732217.pdf?src-supplier=Upverter; ComponentLink2Description: https://datasheet.octopart.com:443/SR0603FR-7T10KL-Yageo-datasheet-119732217.pdf?src-supplier=Upverter; ComponentLink3URL: https://datasheet.octopart.com:443/SR0603FR-7T10KL-Yageo-Group-datasheet-184785656.pdf?src-supplier=Future+Electronics; ComponentLink3Description: https://datasheet.octopart.com:443/SR0603FR-7T10KL-Yageo-Group-datasheet-184785656.pdf?src-supplier=Future+Electronics; ComponentLink4URL: https://datasheet.octopart.com:443/SR0603FR-7T10KL-Yageo-datasheet-155675517.pdf?src-supplier=Future+Electronics; ComponentLink4Description: https://datasheet.octopart.com:443/SR0603FR-7T10KL-Yageo-datasheet-155675517.pdf?src-supplier=Future+Electronics; ComponentLink5URL: https://datasheet.octopart.com:443/SR0603FR-7T10KL-Yageo-datasheet-137701088.pdf?src-supplier=Future+Electronics; ComponentLink5Description: https://datasheet.octopart.com:443/SR0603FR-7T10KL-Yageo-datasheet-137701088.pdf?src-supplier=Future+Electronics; ComponentLink6URL: https://datasheet.octopart.com/SR0603FR-7T10KL-Yageo-datasheet-11047080.pdf; ComponentLink6Description: https://datasheet.octopart.com/SR0603FR-7T10KL-Yageo-datasheet-11047080.pdf; ComponentLink7URL: http://sigma.octopart.com:80/conflict_mineral_statement/Yageo-company-3.pdf?src-supplier=Compliance+Statements; ComponentLink7Description: http://sigma.octopart.com:80/conflict_mineral_statement/Yageo-company-3.pdf?src-supplier=Compliance+Statements; ComponentLink8URL: http://sigma.octopart.com:80/rohs_statement/Yageo-company-2.pdf?src-supplier=Compliance+Statements; ComponentLink8Description: http://sigma.octopart.com:80/rohs_statement/Yageo-company-2.pdf?src-supplier=Compliance+Statements; Stock: 5000; ComponentLink9URL: https://datasheet.octopart.com:443/SR0603FR-7T4R7L-Yageo-datasheet-176402240.pdf?src-supplier=Farnell; ComponentLink9Description: https://datasheet.octopart.com:443/SR0603FR-7T4R7L-Yageo-datasheet-176402240.pdf?src-supplier=Farnell; ComponentLink10URL: https://datasheet.octopart.com:443/SR0603FR-7T4R7L-Yageo-datasheet-119732217.pdf?src-supplier=Upverter; ComponentLink10Description: https://datasheet.octopart.com:443/SR0603FR-7T4R7L-Yageo-datasheet-119732217.pdf?src-supplier=Upverter; ComponentLink11URL: https://datasheet.octopart.com:443/SR0603FR-7T4R7L-Yageo-Group-datasheet-184785656.pdf?src-supplier=Future+Electronics; ComponentLink11Description: https://datasheet.octopart.com:443/SR0603FR-7T4R7L-Yageo-Group-datasheet-184785656.pdf?src-supplier=Future+Electronics; ComponentLink12URL: https://datasheet.octopart.com:443/SR0603FR-7T4R7L-Yageo-datasheet-155675517.pdf?src-supplier=Future+Electronics; ComponentLink12Description: https://datasheet.octopart.com:443/SR0603FR-7T4R7L-Yageo-datasheet-155675517.pdf?src-supplier=Future+Electronics; ComponentLink13URL: https://datasheet.octopart.com:443/SR0603FR-7T4R7L-Yageo-datasheet-137701088.pdf?src-supplier=Future+Electronics; ComponentLink13Description: https://datasheet.octopart.com:443/SR0603FR-7T4R7L-Yageo-datasheet-137701088.pdf?src-supplier=Future+Electronics; ComponentLink14URL: https://datasheet.octopart.com/SR0603FR-7T4R7L-Yageo-datasheet-11047080.pdf; ComponentLink14Description: https://datasheet.octopart.com/SR0603FR-7T4R7L-Yageo-datasheet-11047080.pdf; Max Voltage Rating (DC): 150V; ComponentLink15URL: https://datasheet.octopart.com:443/SG73G1JTTD5102C-KOA-Speer-datasheet-181956059.pdf?src-supplier=IHS; ComponentLink15Description: https://datasheet.octopart.com:443/SG73G1JTTD5102C-KOA-Speer-datasheet-181956059.pdf?src-supplier=IHS; ComponentLink16URL: https://sigma.octopart.com:443/141350679/technical_drawing/KOA-Speer-SG73G1JTTD5102C.pdf?src-supplier=KOA+Speer+SCT; ComponentLink16Description: https://sigma.octopart.com:443/141350679/technical_drawing/KOA-Speer-SG73G1JTTD5102C.pdf?src-supplier=KOA+Speer+SCT; ComponentLink17URL: https://datasheet.octopart.com:443/SG73G1JTTD5102C-KOA-Speer-datasheet-141350755.pdf?src-supplier=KOA+Speer+SCT; ComponentLink17Description: https://datasheet.octopart.com:443/SG73G1JTTD5102C-KOA-Speer-datasheet-141350755.pdf?src-supplier=KOA+Speer+SCT; ComponentLink18URL: http://sigma.octopart.com:80/rohs_statement/KOA-Speer-company-17.pdf?src-supplier=Compliance+Statements; ComponentLink18Description: http://sigma.octopart.com:80/rohs_statement/KOA-Speer-company-17.pdf?src-supplier=Compliance+Statements; ComponentLink19URL: https://datasheet.octopart.com:443/ESR03EZPD5102-ROHM-datasheet-182147624.pdf?src-supplier=IHS; ComponentLink19Description: https://datasheet.octopart.com:443/ESR03EZPD5102-ROHM-datasheet-182147624.pdf?src-supplier=IHS; Case Code (Imperial): 0603; Case Code (Metric): 1608; Depth: 800µm; Lead Free: Lead Free; Military Standard: Not; Schedule B: 8533210045, 8533210045|8533210045, 8533210045|8533210045|8533210045, 8533210045|8533210045|8533210045|8533210045; Termination: SMD/SMT; ComponentLink20URL: https://datasheet.octopart.com:443/RK73H1JTTD68R0F-KOA-Speer-datasheet-181956035.pdf?src-supplier=IHS; ComponentLink20Description: https://datasheet.octopart.com:443/RK73H1JTTD68R0F-KOA-Speer-datasheet-181956035.pdf?src-supplier=IHS; ComponentLink21URL: https://datasheet.octopart.com:443/RK73H1JTTD68R0F-KOA-Speer-datasheet-11590619.pdf?src-supplier=Upverter; ComponentLink21Description: https://datasheet.octopart.com:443/RK73H1JTTD68R0F-KOA-Speer-datasheet-11590619.pdf?src-supplier=Upverter; ComponentLink22URL: https://datasheet.octopart.com:443/RK73H1JTTD68R0F-KOA-Speer-datasheet-149653815.pdf?src-supplier=Newark; ComponentLink22Description: https://datasheet.octopart.com:443/RK73H1JTTD68R0F-KOA-Speer-datasheet-149653815.pdf?src-supplier=Newark; ComponentLink23URL: https://datasheet.octopart.com:443/RK73H1JTTD68R0F-KOA-Speer-datasheet-10854116.pdf?src-supplier=element14+APAC; ComponentLink23Description: https://datasheet.octopart.com:443/RK73H1JTTD68R0F-KOA-Speer-datasheet-10854116.pdf?src-supplier=element14+APAC; Contact Plating: Tin; Features: Anti-Sulfur, Moisture Resistant; Number of Terminations: 2; Radiation Hardening: No; ComponentLink24URL: https://datasheet.octopart.com:443/RNCP0603FTD10K0-Stackpole-Electronics-datasheet-182148179.pdf?src-supplier=IHS; ComponentLink24Description: https://datasheet.octopart.com:443/RNCP0603FTD10K0-Stackpole-Electronics-datasheet-182148179.pdf?src-supplier=IHS; ComponentLink25URL: https://datasheet.octopart.com:443/RNCP0603FTD10K0-Stackpole-Electronics-datasheet-141193801.pdf?src-supplier=Upverter; ComponentLink25Description: https://datasheet.octopart.com:443/RNCP0603FTD10K0-Stackpole-Electronics-datasheet-141193801.pdf?src-supplier=Upverter; ComponentLink26URL: https://datasheet.octopart.com:443/RNCP0603FTD10K0-Stackpole-Electronics-datasheet-38896780.pdf?src-supplier=Upverter; ComponentLink26Description: https://datasheet.octopart.com:443/RNCP0603FTD10K0-Stackpole-Electronics-datasheet-38896780.pdf?src-supplier=Upverter; ComponentLink27URL: https://datasheet.octopart.com:443/RNCP0603FTD10K0-Stackpole-Electronics-datasheet-149178200.pdf?src-supplier=Upverter; ComponentLink27Description: https://datasheet.octopart.com:443/RNCP0603FTD10K0-Stackpole-Electronics-datasheet-149178200.pdf?src-supplier=Upverter; ComponentLink28URL: https://datasheet.octopart.com:443/RNCP0603FTD10K0-Stackpole-Electronics-datasheet-33021030.pdf?src-supplier=Future+Electronics; ComponentLink28Description: https://datasheet.octopart.com:443/RNCP0603FTD10K0-Stackpole-Electronics-datasheet-33021030.pdf?src-supplier=Future+Electronics; ComponentLink29URL: http://sigma.octopart.com:80/15942470/materials_sheet/Stackpole-Electronics-RNCP0603FTD10K0.pdf?src-supplier=Compliance+Statements; ComponentLink29Description: http://sigma.octopart.com:80/15942470/materials_sheet/Stackpole-Electronics-RNCP0603FTD10K0.pdf?src-supplier=Compliance+Statements; ComponentLink30URL: http://sigma.octopart.com:80/141158212/rohs_statement/Stackpole-Electronics-RNCP0603FTD10K0.pdf?src-supplier=Compliance+Statements; ComponentLink30Description: http://sigma.octopart.com:80/141158212/rohs_statement/Stackpole-Electronics-RNCP0603FTD10K0.pdf?src-supplier=Compliance+Statements; ComponentLink31URL: http://sigma.octopart.com:80/141158211/reach_statement/Stackpole-Electronics-RNCP0603FTD10K0.pdf?src-supplier=Compliance+Statements; ComponentLink31Description: http://sigma.octopart.com:80/141158211/reach_statement/Stackpole-Electronics-RNCP0603FTD10K0.pdf?src-supplier=Compliance+Statements